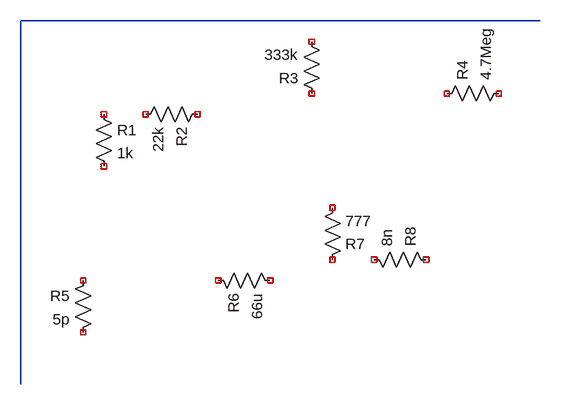
[diagram p0: schematic part_text.asc]
part_text.asc, the LTspice schematic file:
Version 4
SHEET 1 880 640
WIRE -48 -64 752 -64
WIRE -48 -64 -48 496
SYMBOL res 64 64 R0
SYMATTR InstName R1
SYMATTR Value 1k
SYMBOL res 240 64 R90
SYMATTR InstName R2
SYMATTR Value 22k
SYMBOL res 416 64 R180
SYMATTR InstName R3
SYMATTR Value 333k
SYMBOL res 592 64 R270
SYMATTR InstName R4
SYMATTR Value 4.7Meg
SYMBOL res 64 320 M0
SYMATTR InstName R5
SYMATTR Value 5p
SYMBOL res 240 320 M90
SYMATTR InstName R6
SYMATTR Value 66u
SYMBOL res 416 320 M180
SYMATTR InstName R7
SYMATTR Value 777
SYMBOL res 592 320 M270
SYMATTR InstName R8
SYMATTR Value 8n

The netlist it stands for:
* part_text.asc
R1 NC_01 NC_02 1k
R2 NC_03 NC_04 22k
R3 NC_05 NC_06 333k
R4 NC_07 NC_08 4.7Meg
R5 NC_09 NC_10 5p
R6 NC_11 NC_12 66u
R7 NC_13 NC_14 777
R8 NC_15 NC_16 8n
.backanno
.end